# EasyEDA Pro project 集成板.eprj, schematic 指示面板3.1
Board Name: 指示面板1.1; Create Date: 2025-04-26; Page Name: P1; Project Name: 集成板; Schematic Name: Schematic4; Update Date: 2025-04-26; Add into BOM: yes; Company: 嘉立创EDA; Convert to PCB: yes; Page Size: A4; Version: V1.0
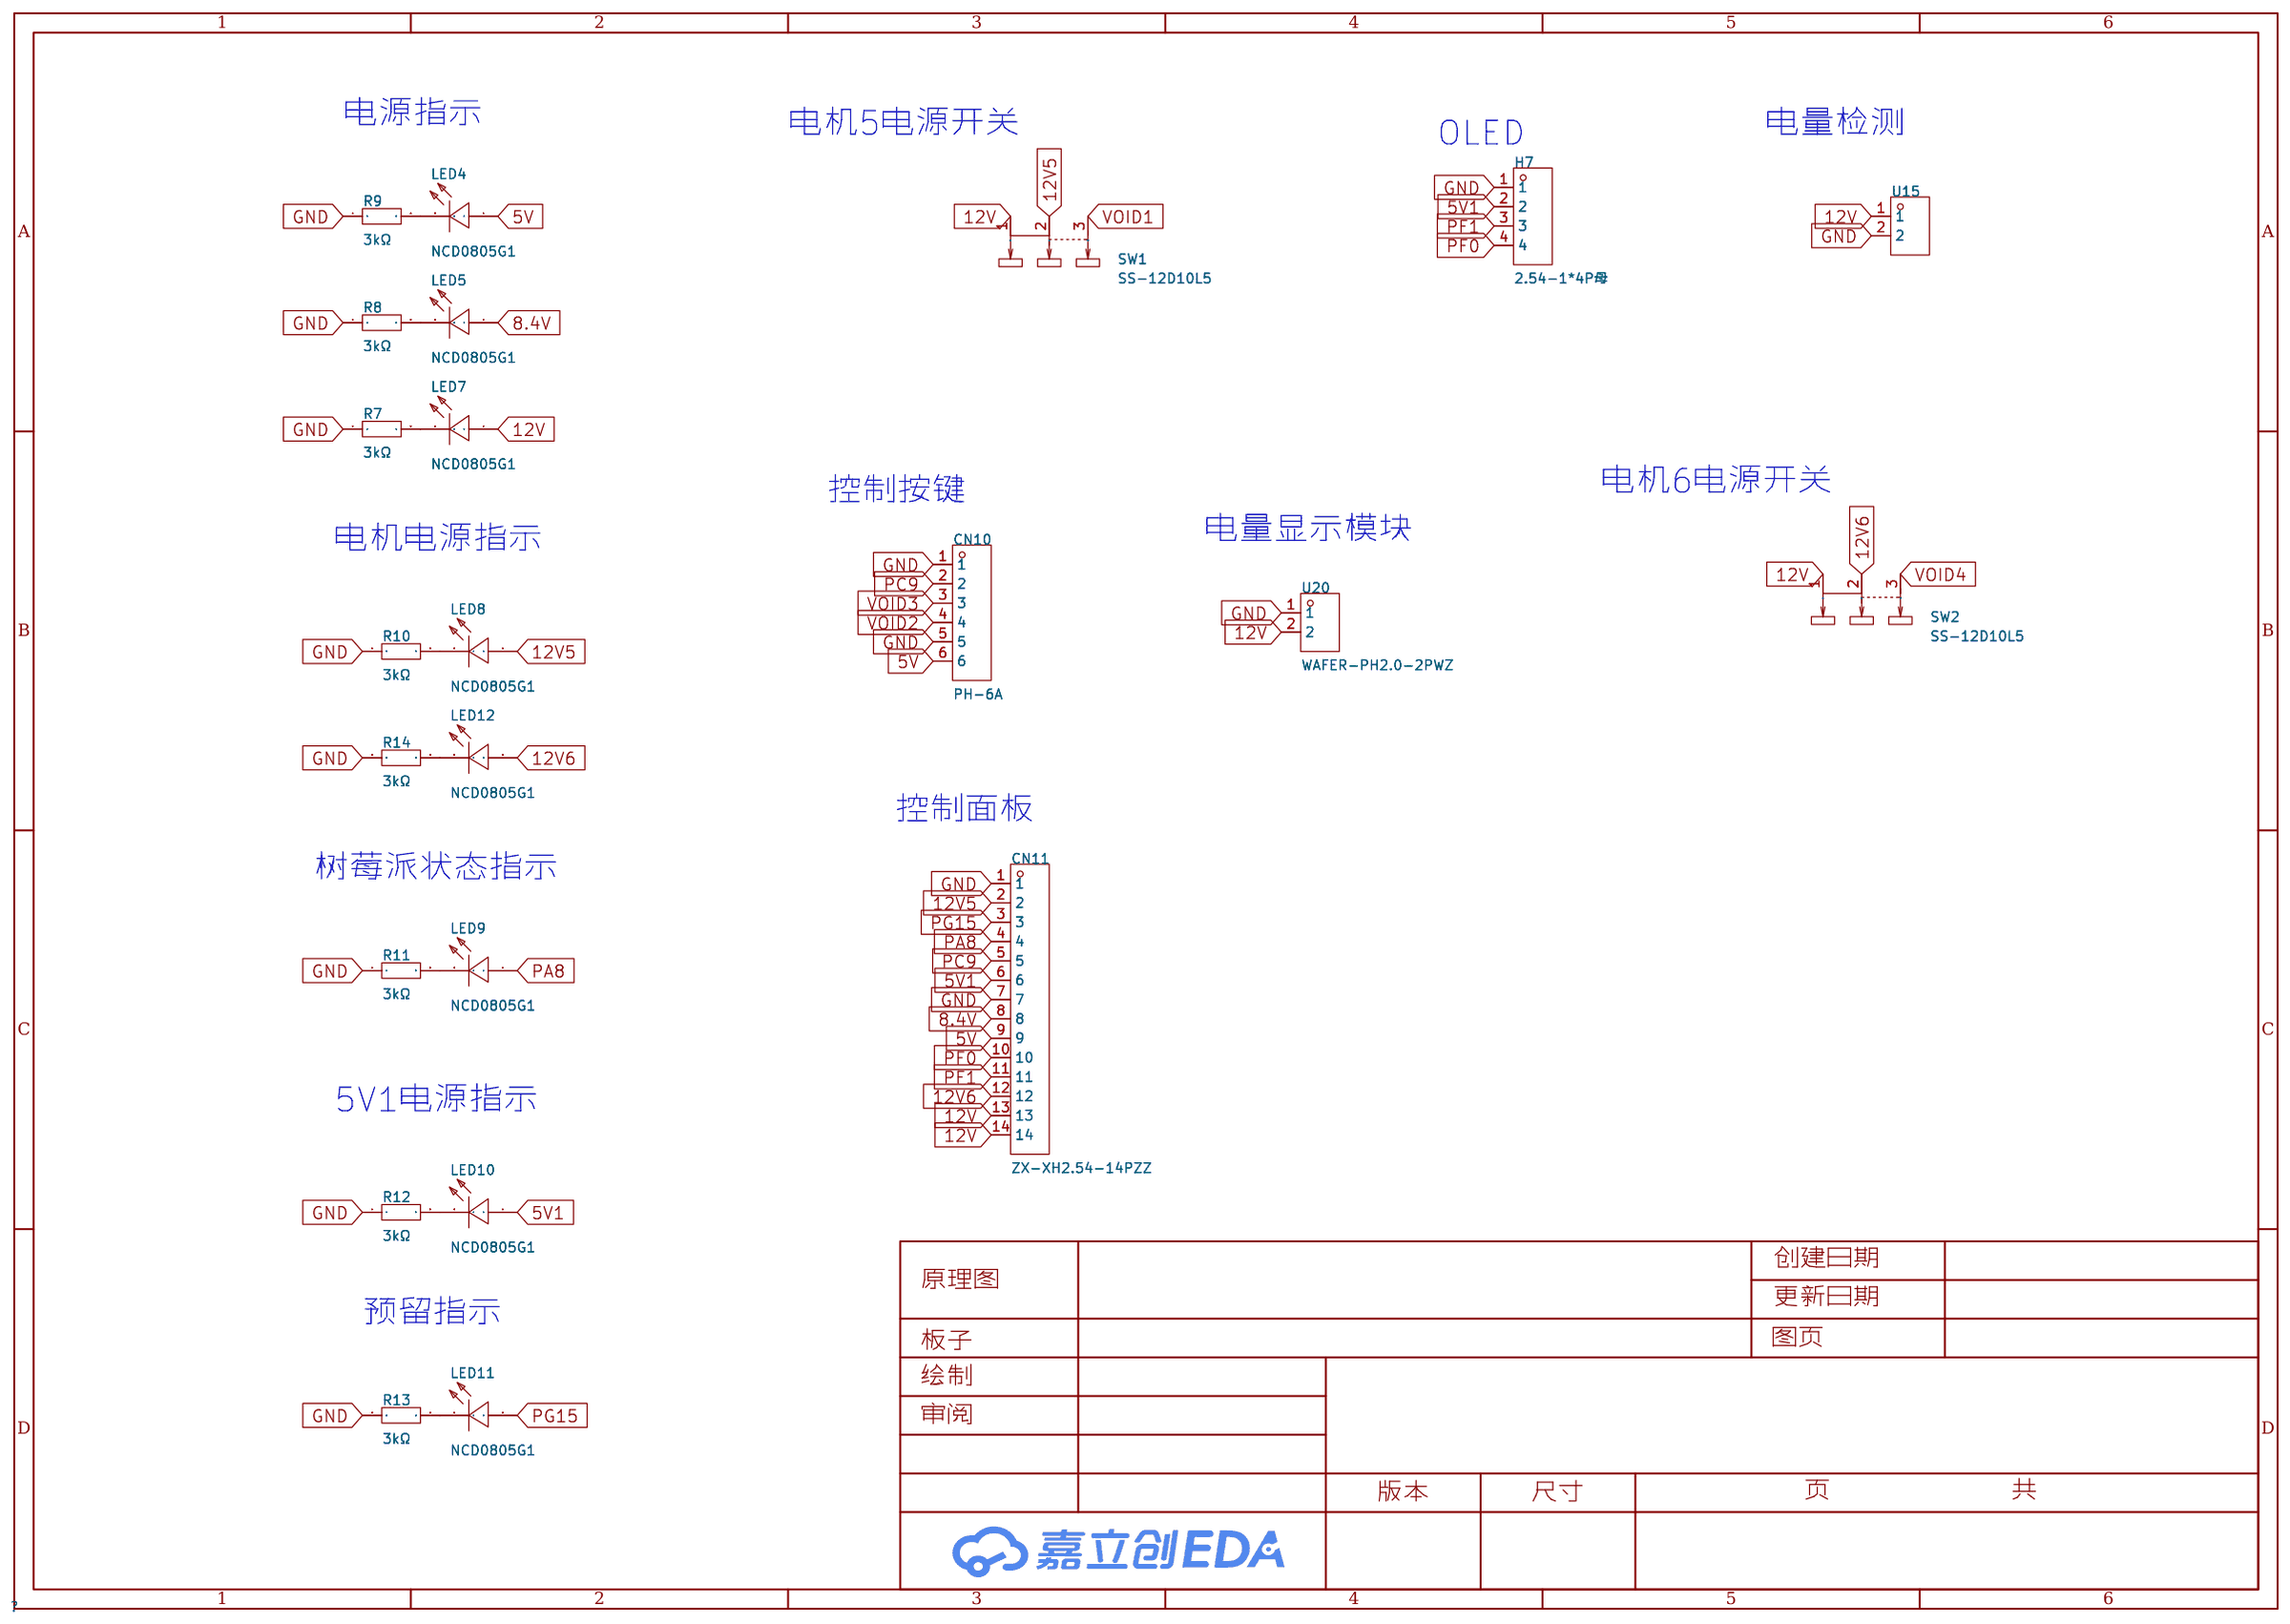
[diagram p3: schematic sheet]

## Parts
CN10  PH-6A  [CONN-TH_6P-P2.00_PH-6A_C2908627]
CN11  ZX-XH2.54-14PZZ  [CONN-TH_14P-P2.50_ZX-XH2.54-14PZZ]
H7  2.54-1*4P母  [HDR-TH_4P-P2.54-V-F]
LED4  NCD0805G1  [LED0805-R-RD]
LED5  NCD0805G1  [LED0805-R-RD]
LED7  NCD0805G1  [LED0805-R-RD]
LED8  NCD0805G1  [LED0805-R-RD]
LED9  NCD0805G1  [LED0805-R-RD]
LED10  NCD0805G1  [LED0805-R-RD]
LED11  NCD0805G1  [LED0805-R-RD]
LED12  NCD0805G1  [LED0805-R-RD]
R7  3kΩ  [R0805]
R8  3kΩ  [R0805]
R9  3kΩ  [R0805]
R10  3kΩ  [R0805]
R11  3kΩ  [R0805]
R12  3kΩ  [R0805]
R13  3kΩ  [R0805]
R14  3kΩ  [R0805]
SW1  SS-12D10L5  [SW-TH_SS-12D10L5]
SW2  SS-12D10L5  [SW-TH_SS-12D10L5]
U15  KF301-5.0-2P  [CONN-TH_P5.00_KF301-5.0-2P]
U20  WAFER-PH2.0-2PWZ  [CONN-TH_2P-P2.00_GP01-2001WR-2P]

## Library data of the parts
CN10 = PH-6A_C2908627: 插针结构:1x6P;间距:2mm;安装方式:直插;参考系列:PH;总PIN数:6P;排数:1;每排PIN数:6;行距:-;额定电流:2A;触头材质:黄铜;触头镀层:锡;工作温度范围:-25℃~+85℃;; LCSC Part Name: 1x6P 间距:2mm 直插 系列:PH; Supplier Part: C2908627; Manufacturer: HCTL(华灿天禄); Supplier Footprint: 插件,P=2mm; JLCPCB Part Class: 扩展库; Datasheet: https://atta.szlcsc.com/upload/public/pdf/source/20230707/BA576CECAD32FECA9ECBAF2430E681CE.pdf; Supplier: LCSC; Pins Structure: 1x6P; Pitch: 2mm; Mounting Style: 直插; Reference Series: PH; Number of Pins: 6P; Number of Rows: 1; Number of PINs Per Row: 6; Current Rating (Max): 2A; Contact Material: 黄铜; Contact Plating: 锡; Operating Temperature Range: -25℃~+85℃
CN11 = ZX-XH2.54-14PZZ: LCSC Part Name: 1x14P 间距:2.5mm 直插 系列:XH; Supplier Part: C22366170; Manufacturer: Megastar(兆星); Supplier Footprint: 插件,P=2.54mm; JLCPCB Part Class: 扩展库; Datasheet: https://atta.szlcsc.com/upload/public/pdf/source/20240326/867C2E693C2B8D00E51A366B538343B4.pdf; Supplier: LCSC; Pins Structure: 1x14P; Pitch: 2.5mm; Mounting Type: 直插; Reference Series: XH; Number of Pins: 14P; Number of Rows: 1; Number of PINs Per Row: 14; Rated Current: 3A; Contact Material: 黄铜; Contact Plating: 锡; Operating Temperature: -25℃~+85℃; Rated Voltage (Max): 250V; Plastic Material: PA66; Flame Retardant Rating: UL94V-0; Color: 白色; Z-Height of the Board: 7mm; X-Length of Bottom Edge on Board (Spacing Line): 37.5mm; Y-Width of Bottom Edge on Board: 5.9mm
H7 = 2.54-1*4P母: 插孔结构:1x4P;间距:2.54mm;行距:-;圆孔/方孔:方孔;安装类型:直插;排数:单排;总孔位数:4P;额定电流:3A;额定电压:-;插孔方向:顶部;塑高:-;触头材质:青铜;触头镀层:-;工作温度范围:-40℃~+105℃;焊接温度(最大值):-;; LCSC Part Name: 间距:2.54mm 1x4P 直插; Supplier Part: C2718488; Manufacturer: BOOMELE(博穆精密); Supplier Footprint: 插件,P=2.54mm; JLCPCB Part Class: 扩展库; Datasheet: https://atta.szlcsc.com/upload/public/pdf/source/20210301/C2718488_F4427B881E42CAA8DDB0B1C12B3A522C.pdf; Supplier: LCSC; Holes Structure: 1x4P; Pitch: 2.54mm; Circular Hole / Square Hole: 方孔; Mounting Type: 直插; Number of Rows: 单排; Number of Holes: 4P; Current Rating (Max): 3A; Holes Direction: 顶部; Contact Material: 青铜; Operating Temperature Range: -40℃~+105℃
LED4 LED5 LED7-LED12 = NCD0805G1: 发光颜色:翠绿色;正向电压(VF):2.5V~3.6V;功率:72mW;正向电流:5mA;主波长:525nm~537.5nm;透镜颜色:无色透明透镜;发光强度:180mcd~400mcd;发光角度:130°;工作温度:-30℃~+85℃;; Supplier Part: C84260; Manufacturer: 国星光电; Supplier Footprint: 0805; JLCPCB Part Class: 扩展库; Datasheet: https://atta.szlcsc.com/upload/public/pdf/source/20200820/C84260_AFC7BF57C6FBA034D182BB8D10A67EFE.pdf; Supplier: LCSC; Emitted Color: 翠绿色; Forward Voltage (VF): 2.5V~3.6V; Power Dissipation: 72mW; Forward Current: 5mA; Dominant Wavelength: 525nm~537.5nm; Lens Color: 无色透明透镜; Luminous Intensity: 180mcd~400mcd; Viewing Angle: 130°; Operating Temperature: -30℃~+85℃
R7-R14 = 0805W8F3001T5E: 电阻类型:厚膜电阻;阻值:3kΩ;精度:±1%;功率:125mW;最大工作电压:150V;温度系数:±100ppm/℃;; LCSC Part Name: 3kΩ ±1% 125mW 厚膜电阻; Supplier Part: C17661; Manufacturer: UNI-ROYAL(厚声); Supplier Footprint: 0805; JLCPCB Part Class: 基础库; Datasheet: https://atta.szlcsc.com/upload/public/pdf/source/20200306/C422600_1E6D84923E4A46A82E41ADD87F860B5C.pdf; Supplier: LCSC; Type: 厚膜电阻; Tolerance: ±1%; Power(Watts): 125mW; Overload Voltage (Max): 150V; Temperature Coefficient: ±100ppm/℃; Operating Temperature Range: -55℃~+155℃
SW1 SW2 = SS-12D10L5: 电路结构:单刀双掷;安装方式:直插;开关颜色:黑色;额定电流(DC):3A;额定电压(DC):125V;额定电流(AC):3A;额定电压(AC):125V;机械寿命:1万次;; LCSC Part Name: 柄长5mm 直插双档 滑动开关; Supplier Part: C319012; Manufacturer: XKB Connectivity(中国星坤); Supplier Footprint: 插件; JLCPCB Part Class: 扩展库; Datasheet: https://atta.szlcsc.com/upload/public/pdf/source/20211009/D6412F37AABE6F9459A6EE7FA4DAEADB.pdf; Supplier: LCSC; Circuit: 单刀双掷; Actuator Style: 矩形柱状; Pin Style: PC引脚; Switch Length: 13mm; Switch Width: 6.8mm; Switch Height: 6.4mm; Mounting Style: 直插; Actuator Color: 黑色; Current Rating (DC): 3A; Voltage Rating (DC): 125V; Current Rating (AC): 3A; Voltage Rating (AC): 125V; Mechanical Life: 1万次; Operating Temperature: -40℃~+85℃
U15 = KF301-5.0-2P: 结构:1x2P;间距:5mm;颜色:蓝色;安装方式:直插;额定电流:17A;额定电压:250V;排数:1;线规 - AWG:14~22;线规 - 平方毫米:1.5;每排PIN数:2;工作温度范围:-30℃~+120℃;; LCSC Part Name: 5mm 1x2P 排数:1 每排P数:2 直插; Supplier Part: C474881; Manufacturer: KEFA(科发); Supplier Footprint: 插件,P=5mm; JLCPCB Part Class: 扩展库; Datasheet: https://atta.szlcsc.com/upload/public/pdf/source/20230317/03A5B5FC229D6F9225E8F51DA1A4E80A.pdf; Supplier: LCSC; Structure: 1x2P; Pitch: 5mm; Color: 蓝色; Mounting Style: 直插; Current Rating (Max): 17A; Voltage Rating (Max): 250V; Number of Pins: 2P; Number of Rows: 1; Wire Gauge - AWG: 14~22; Wire Gauge - mm2: 1.5; Number of PINs Per Row: 2; Operating Temperature Range: -30℃~+120℃
U20 = WAFER-PH2.0-2PWZ: 插针结构:1x2P;间距:2mm;安装方式:弯插;参考系列:PH;总PIN数:2P;排数:1;每排PIN数:2;额定电流:2A;工作温度范围:-25℃~+85℃;; LCSC Part Name: PH 2.0mm 1x2P 弯插; Supplier Part: C5359610; Manufacturer: XUNPU(讯普); Supplier Footprint: 弯插,P=2mm; JLCPCB Part Class: 扩展库; Datasheet: https://atta.szlcsc.com/upload/public/pdf/source/20230728/47B07572F36CD4F6F91BE29B817CECA3.pdf; Supplier: LCSC; Pins Structure: 1x2P; Pitch: 2mm; Mounting Style: 弯插; Reference Series: PH; Number of Pins: 2P; Number of Rows: 1; Number of PINs Per Row: 2; Current Rating (Max): 2A; Operating Temperature Range: -25℃~+85℃

## Nets
5V: CN10.6 CN11.9 LED4.1(A)
5V1: CN11.6 H7.2 LED10.1(A)
8.4V: CN11.8 LED5.1(A)
12V: CN11.13 CN11.14 LED7.1(A) SW1.1 SW2.1 U15.1 U20.2
12V5: CN11.2 LED8.1(A) SW1.2
12V6: CN11.12 LED12.1(A) SW2.2
GND: CN10.1 CN10.5 CN11.1 CN11.7 H7.1 R7.1 R8.1 R9.1 R10.1 R11.1 R12.1 R13.1 R14.1 U15.2 U20.1
PA8: CN11.4 LED9.1(A)
PC9: CN10.2 CN11.5
PF0: CN11.10 H7.4
PF1: CN11.11 H7.3
PG15: CN11.3 LED11.1(A)
VOID1: SW1.3
VOID2: CN10.4
VOID3: CN10.3
VOID4: SW2.3
$1N1259: LED7.2(K) R7.2
$1N1261: LED5.2(K) R8.2
$1N1263: LED4.2(K) R9.2
$1N1273: LED8.2(K) R10.2
$1N1276: LED9.2(K) R11.2
$1N1287: LED10.2(K) R12.2
$1N1806: LED11.2(K) R13.2
$1N1907: LED12.2(K) R14.2

## Notes on the sheet
- 电源指示
- 电机5电源开关
- OLED
- 电量检测
- 电机6电源开关
- 控制按键
- 电量显示模块
- 电机电源指示
- 控制面板
- 树莓派状态指示
- 5V1电源指示
- 预留指示
